# Altium project Docking-Station-PCB_Project.PrjPcb
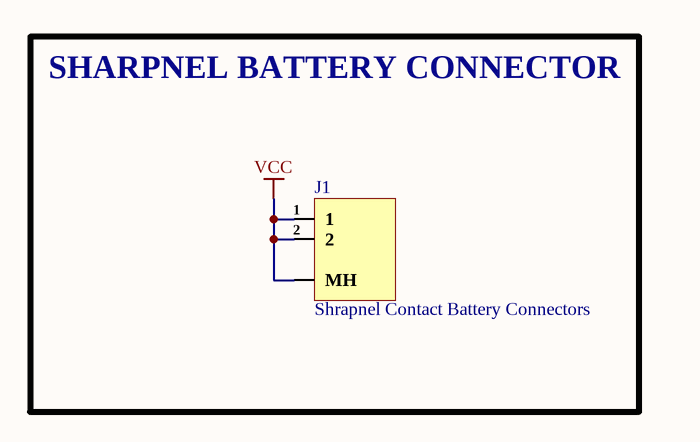
[diagram p0: Docking-Station.SchDoc]
1 sheet, 1 parts. Net scope: global (net labels, ports and power ports of the same name join across sheets).
Board file: Docking-Station-PCB.PcbDoc

## Sheet Docking-Station.SchDoc
size A4; SheetNumber: 1; SheetTotal: 1

### Parts
J1  Shrapnel Contact Battery Connectors  [Shrapnel Contact Battery Connectors]

### Blocks framed on the sheet
SHARPNEL BATTERY CONNECTOR: J1

### Nets
VCC: J1.1 J1.2 J1.MH

### Notes on the sheet
- File:
- Title:
- Date:
- Page
- Num:
- Total:
- Drawn By: Huzaifa Ali

### Library data of the parts
J1 = Shrapnel Contact Battery Connectors: 2P Shrapnel Contact Battery Connectors